# Altium schematic sheet Wifi.SchDoc: WIFI / BLE
size A4; Author: Silvio Navaretti; CompanyName: Arduino srl; DocumentNumber: ABX00063; Revision: V1.4; SheetNumber: 6; SheetTotal: 8; RevAuthor: Silvio Navaretti
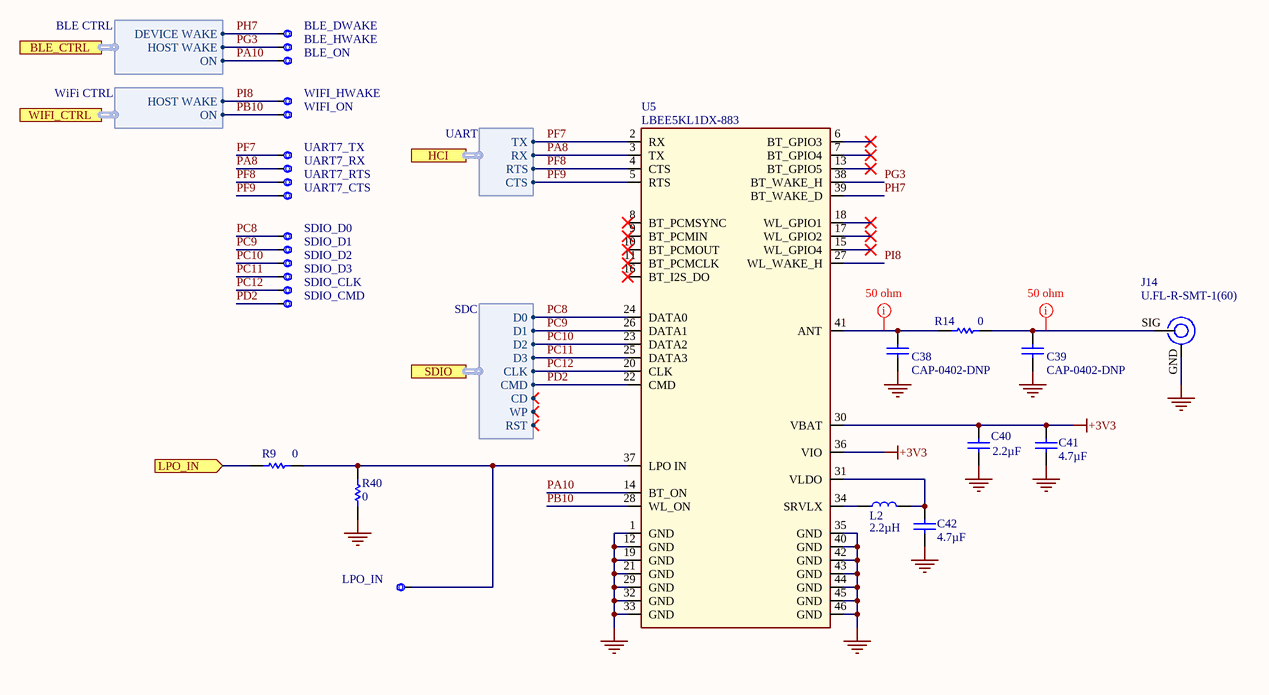
[diagram p0: Wifi.SchDoc]

## Parts
BLE_DWAKE  CMP-018-0005-A.3  [TP-1.00MM]  (value not drawn)  (no BOM)
BLE_HWAKE  CMP-018-0005-A.3  [TP-1.00MM]  (value not drawn)  (no BOM)
BLE_ON  CMP-018-0005-A.3  [TP-1.00MM]  (value not drawn)  (no BOM)
C38  CAP-0402-DNP  [CAP-0402]
C39  CAP-0402-DNP  [CAP-0402]
C40  value 2.2µF  [CAP-0402]  (hidden comment: GRM155R60J225KE95D)
C41  value 4.7µF  [CAP-0402]  (hidden comment: C1005A475M6R3NT)
C42  value 4.7µF  [CAP-0402]  (hidden comment: C1005A475M6R3NT)
J14  U.FL-R-SMT-1(60)  [U.FL-R-SMT-1(60)-1]
L2  value 2.2µH  [FP-LQM18PN_GH-IPC_C]  (hidden comment: LQM18PN2R2MGHD)
LPO_IN  CMP-018-0005-A.3  [TP-1.00MM]  (value not drawn)  (no BOM)
R9  value 0  [RES-0402]  (hidden comment: CRCW04020000Z0EDC)
R14  value 0  [RES-0402]  (hidden comment: CRCW04020000Z0EDC)
R40  value 0  [RES-0402]  (hidden comment: CRCW04020000Z0EDC)
SDIO_CLK  CMP-018-0005-A.3  [TP-1.00MM]  (value not drawn)  (no BOM)
SDIO_CMD  CMP-018-0005-A.3  [TP-1.00MM]  (value not drawn)  (no BOM)
SDIO_D0  CMP-018-0005-A.3  [TP-1.00MM]  (value not drawn)  (no BOM)
SDIO_D1  CMP-018-0005-A.3  [TP-1.00MM]  (value not drawn)  (no BOM)
SDIO_D2  CMP-018-0005-A.3  [TP-1.00MM]  (value not drawn)  (no BOM)
SDIO_D3  CMP-018-0005-A.3  [TP-1.00MM]  (value not drawn)  (no BOM)
U5  LBEE5KL1DX-883  [LBEE5KL1DX-883]
UART7_CTS  CMP-018-0005-A.3  [TP-1.00MM]  (value not drawn)  (no BOM)
UART7_RTS  CMP-018-0005-A.3  [TP-1.00MM]  (value not drawn)  (no BOM)
UART7_RX  CMP-018-0005-A.3  [TP-1.00MM]  (value not drawn)  (no BOM)
UART7_TX  CMP-018-0005-A.3  [TP-1.00MM]  (value not drawn)  (no BOM)
WIFI_HWAKE  CMP-018-0005-A.3  [TP-1.00MM]  (value not drawn)  (no BOM)
WIFI_ON  CMP-018-0005-A.3  [TP-1.00MM]  (value not drawn)  (no BOM)

## Ports
BLE_CTRL (harness BLE CTRL), HCI (harness UART), LPO_IN (in), SDIO (harness SDC), WIFI_CTRL (harness WiFi CTRL)

## Harnesses
BLE CTRL: HOST WAKE, DEVICE WAKE, ON
UART: RX, TX, RTS, CTS
WiFi CTRL: HOST WAKE, ON
SDC: CLK, CMD, D0, D1, D2, D3, CD, WP, RST

## Nets
+3V3: C40.2 C41.1 U5.30(VBAT) U5.36(VIO)
GND: C38.2 C39.2 C40.1 C41.2 C42.2 J14.GND R40.1 U5.1(GND) U5.12(GND) U5.19(GND) U5.21(GND) U5.29(GND) U5.32(GND) U5.33(GND) U5.35(GND) U5.40(GND) U5.42(GND) U5.43(GND) U5.44(GND) U5.45(GND) U5.46(GND)
LPO_IN: R9.1 ; port LPO_IN
PA8: U5.3(TX) UART7_RX.X ; port HCI.RX
PA10: BLE_ON.X U5.14(BT_ON) ; port BLE_CTRL.ON
PB10: U5.28(WL_ON) WIFI_ON.X ; port WIFI_CTRL.ON
PC8: SDIO_D0.X U5.24(DATA0) ; port SDIO.D0
PC9: SDIO_D1.X U5.26(DATA1) ; port SDIO.D1
PC10: SDIO_D2.X U5.23(DATA2) ; port SDIO.D2
PC11: SDIO_D3.X U5.25(DATA3) ; port SDIO.D3
PC12: SDIO_CLK.X U5.20(CLK) ; port SDIO.CLK
PD2: SDIO_CMD.X U5.22(CMD) ; port SDIO.CMD
PF7: U5.2(RX) UART7_TX.X ; port HCI.TX
PF8: U5.4(CTS) UART7_RTS.X ; port HCI.RTS
PF9: U5.5(RTS) UART7_CTS.X ; port HCI.CTS
PG3: BLE_HWAKE.X U5.38(BT_WAKE_H) ; port BLE_CTRL.HOST WAKE
PH7: BLE_DWAKE.X U5.39(BT_WAKE_D) ; port BLE_CTRL.DEVICE WAKE
PI8: U5.27(WL_WAKE_H) WIFI_HWAKE.X ; port WIFI_CTRL.HOST WAKE
NetC38_1: C38.1 R14.1 U5.41(ANT)
NetC39_1: C39.1 J14.SIG R14.2
NetC42_1: C42.1 L2.2 U5.31(VLDO)
NetL2_1: L2.1 U5.34(SRVLX)
NetLPO_IN_X: LPO_IN.X R9.2 R40.2 U5.37(LPO_IN)

Not connected (* = marked no-connect by the designer): U5 6(BT_GPIO3)* 7(BT_GPIO4)* 8(BT_PCMSYNC)* 9(BT_PCMIN)* 10(BT_PCMOUT)* 11(BT_PCMCLK)* 13(BT_GPIO5)* 15(WL_GPIO4)* 16(BT_I2S_DO)* 17(WL_GPIO2)* 18(WL_GPIO1)*

## Layout directives
net class 50 ohm: NetC38_1, NetC39_1

## Notes on the sheet
- Title:
- ID:
- Date:
- Time:
- Version:
- Sheet
- of
- RevAuthor:
- Reference Designs ARE PROVIDED "AS IS" AND "WITH ALL FAULTS. Arduino SA DISCLAIMS ALL OTHER WARRANTIES, EXPRESS OR IMPLIED, REGARDING PRODUCTS, INCLUDING BUT NOT LIMITED TO, ANY IMPLIED WARRANTIES OF MERCHANTABILITY OR FITNESS FOR A PARTICULAR PURPOSE.
  Arduino SA may make changes to specifications and product descriptions at any time, without notice. The Customer must not rely on the absence or characteristics of any features or instructions marked "reserved" or "undefined". Arduino SA reserves these for future definition and shall have no responsibility whatsoever for conflicts or incompatibilities arising from future changes to them. The product information on the Web Site or Materials is subject to change without notice.
  Do not finalize a design with this info. ARDUINO and other Arduino brands and logos and Trademarks of Arduino SA. All Arduino SA Trademarks cannot be used without owner's formal permission.
- File:
- Author:

## Library data of the parts
BLE_DWAKE BLE_HWAKE BLE_ON LPO_IN SDIO_CLK SDIO_CMD SDIO_D0-SDIO_D3 UART7_CTS UART7_RTS UART7_RX UART7_TX WIFI_HWAKE WIFI_ON = UT0013-A.4: Test point 1.00mm; Design Item ID: CMP-018-0005-A.3; Source: ut.SchLib; Pin Count: 1
C38 C39 = UT0021-A.3: DNP CAP 0402; Package: 0402; Part Number: DNP
C40 = C0031-A.14: CAP CHIP 0402 2.2uF 10% 6.3V X5R; Manufacturer: Murata; Code Arduino: A5529; Voltage: 6.3V; Part Number: GRM155R60J225KE95D; Dielectric: X5R; Case Code (Imperial): 0402; Tolerance: 10%; Technology: Ceramic
C41 C42 = C0037-A.14: CAP CHIP 0402 4.7uF 20% 6V3 X5R; Manufacturer: Hottech; Code Arduino: 0833; Voltage: 6.3V; Manufacturer 2: Samsung Electro-Mechanics; Dielectric: X5R; Part Number: C1005A475M6R3NT; Tolerance: 20%; Case Code (Imperial): 0402; Technology: Ceramic; Manufacturer 3: Murata Electronics; Part number 3: GRM155R60J475ME47D; Part number 2: CL05A475KQ5NRNC
J14 = J0045-A.8: CONN Micro UFL; Manufacturer: Hirose; Code Arduino: A5364; Part Number: U.FL-R-SMT-1(60); Pin Count: 3
L2 = I0051-A.5: IND FIXED SMD 0603 2.2uH, 20%,; Manufacturer: Murata; Code Arduino: I0051; Test Frequency: 1MHz; DC Resistance (DCR): 250mR; Max Operating Temperature: 85°C; Part Number: LQM18PN2R2MGHD; Device Type: Inductor; Tolerance: 20%; Case Code (Imperial): 0603; Min Operating Temperature: -40°C; Inductance: 2.2µH
R9 R40 = R0000-A.23: RES CHIP 0402 0R 1/16W; Manufacturer: Vishay; Power: 62.5mW; Tolerance: 0%; Code Arduino: 0039; Temperature coefficient: 0ppm; Part Number: CRCW04020000Z0EDC; Case Code (Imperial): 0402; Technology: Thick film
R14 = R0000-A.23: RES CHIP 0402 0R 1/16W; Manufacturer: Vishay; Code Arduino: 0039; Tolerance: 0%; Power: 62.5mW; Temperature coefficient: 0ppm; Case Code (Imperial): 0402; Part Number: CRCW04020000Z0EDC; Technology: Thick film
U5 = U0008-A.17: MODULE WiFi 11b/g/n+BLUETOOTH 4.2 SHIELDED ULTRA SMALL LBEE5KL1DX; Manufacturer: Murata; Code Arduino: U0008; Part Number: LBEE5KL1DX-883